# Altium schematic sheet Push_Button.SchDoc
size A4; SheetNumber: 2; SheetTotal: 7
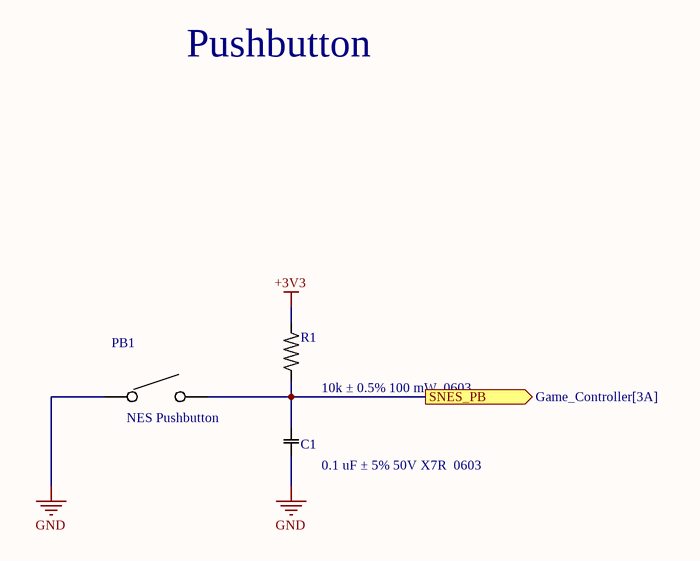
[diagram p0: Push_Button.SchDoc]

## Parts
C1  0.1 uF ± 5% / 50V X7R / 0603  [0603_CAP]
PB1  NES Pushbutton  [SNES_PB]
R1  10k ± 0.5% / 100 mW / 0603  [0603_RES]

## Ports
SNES_PB (out, see Game_Controller[3A])

## Nets
+3V3: R1.2
GND: C1.2 PB1.1
SNES_PB: C1.1 PB1.2 R1.1 ; port SNES_PB

## Notes on the sheet
- Pushbutton

## Library data of the parts
C1 = 3: Manufacturer: Yageo; Manufacturer Part Number: CC0603JRX7R9BB104; CID: 3
PB1 = 15: Manufacturer: Custom; CID: 15; Manufacturer Part Number: Custom
R1 = 6: Manufacturer: Yageo; Manufacturer Part Number: AC0603DRE0710KL; CID: 6